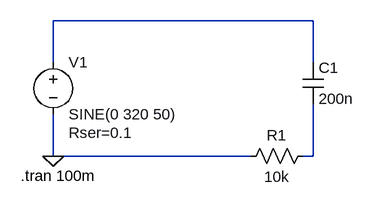
[diagram p0: schematic mains_power.asc]
mains_power.asc, the LTspice schematic file:
Version 4
SHEET 1 880 680
WIRE 368 80 -32 80
WIRE -32 144 -32 80
WIRE 368 144 368 80
WIRE -32 288 -32 224
WIRE 272 288 -32 288
WIRE 368 288 368 208
WIRE 368 288 352 288
FLAG -32 288 0
SYMBOL voltage -32 128 R0
WINDOW 123 0 0 Left 0
WINDOW 39 24 124 Left 2
SYMATTR InstName V1
SYMATTR Value SINE(0 320 50)
SYMATTR SpiceLine Rser=0.1
SYMBOL cap 352 144 R0
SYMATTR InstName C1
SYMATTR Value 200n
SYMBOL res 368 272 R90
WINDOW 0 0 56 VBottom 2
WINDOW 3 32 56 VTop 2
SYMATTR InstName R1
SYMATTR Value 10k
TEXT -82 318 Left 2 !.tran 100m

The netlist it stands for:
* mains_power.asc
V1 N001 0 SINE(0 320 50) Rser=0.1
C1 N001 N002 200n
R1 N002 0 10k
.tran 100m
.backanno
.end